# Altium schematic sheet double_single_to_diff_conv.SchDoc: Single ended to differential analog signal conversion
size A4; DocumentNumber: ADC-SCH-08; SheetNumber: 8; SheetTotal: 20
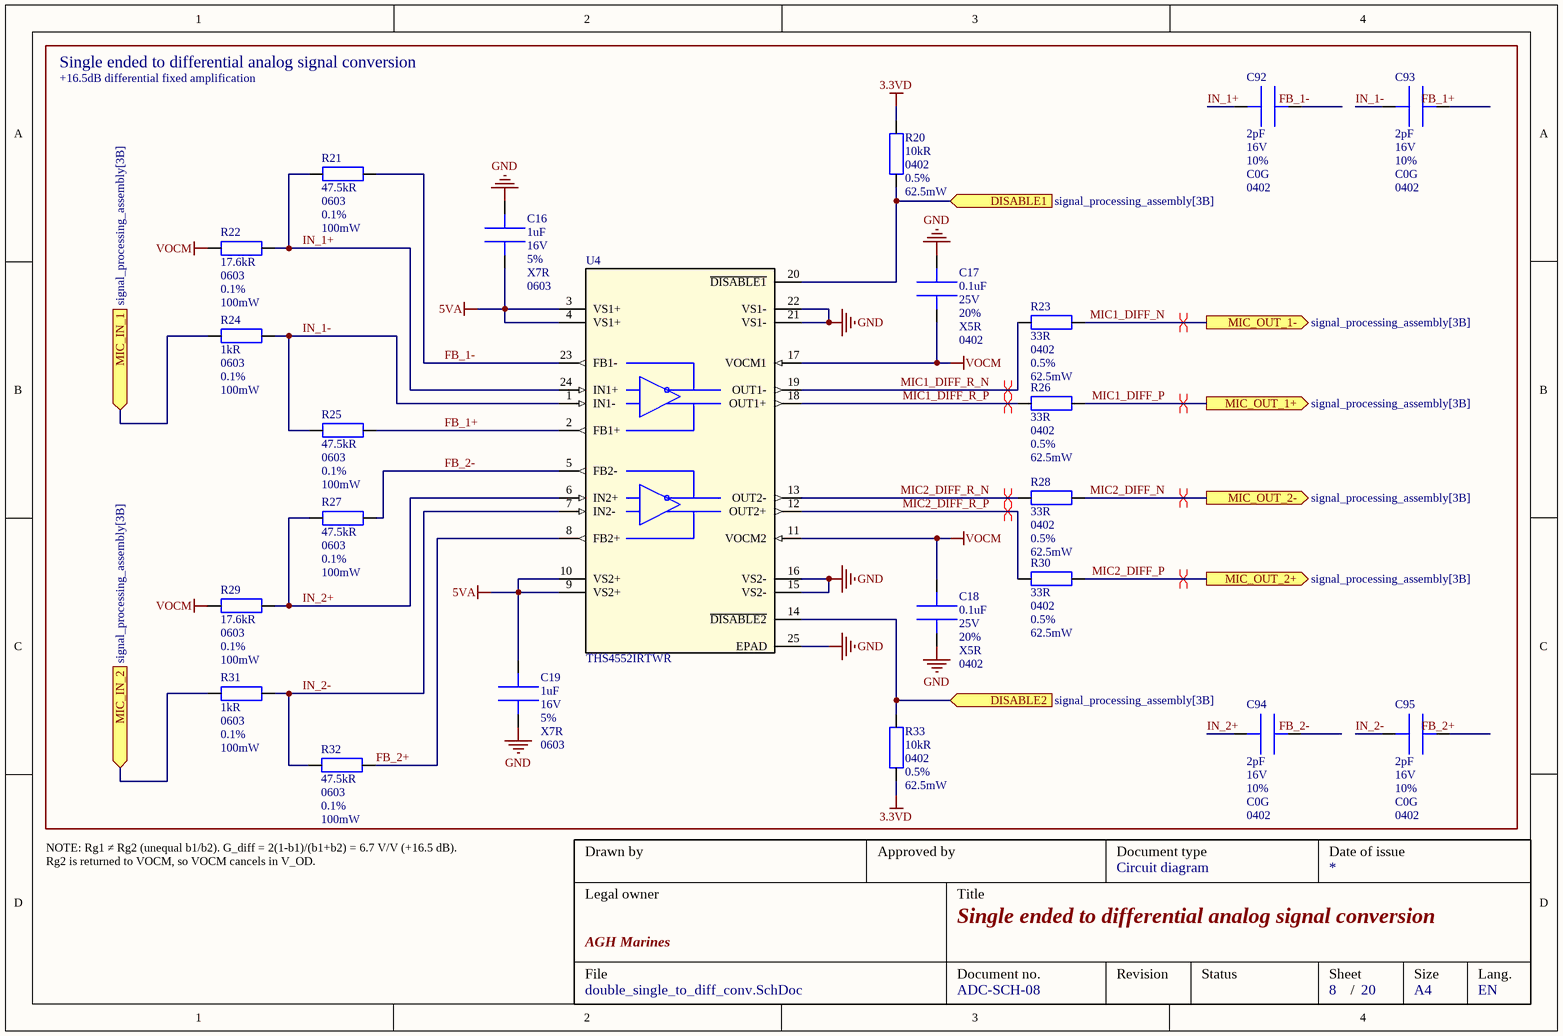
[diagram p0: double_single_to_diff_conv.SchDoc]

## Parts
C16  value 1uF  Voltage: 16V  Tolerance: 5%  Dielectric: X7R  Package: 0603  [CAPC_0603]  (hidden comment: CC0603JRX7R7BB105)
C17  value 0.1uF  Voltage: 25V  Tolerance: 20%  Dielectric: X5R  Package: 0402  [CAPC_0402]  (hidden comment: MSAST105SB5104MFNA01)
C18  value 0.1uF  Voltage: 25V  Tolerance: 20%  Dielectric: X5R  Package: 0402  [CAPC_0402]  (hidden comment: MSAST105SB5104MFNA01)
C19  value 1uF  Voltage: 16V  Tolerance: 5%  Dielectric: X7R  Package: 0603  [CAPC_0603]  (hidden comment: CC0603JRX7R7BB105)
C92  value 2pF  Voltage: 16V  Tolerance: 10%  Dielectric: C0G  Package: 0402  [CAPC_0402]  (hidden comment: GJM1555C1H2R0CB01J)
C93  value 2pF  Voltage: 16V  Tolerance: 10%  Dielectric: C0G  Package: 0402  [CAPC_0402]  (hidden comment: GJM1555C1H2R0CB01J)
C94  value 2pF  Voltage: 16V  Tolerance: 10%  Dielectric: C0G  Package: 0402  [CAPC_0402]  (hidden comment: GJM1555C1H2R0CB01J)
C95  value 2pF  Voltage: 16V  Tolerance: 10%  Dielectric: C0G  Package: 0402  [CAPC_0402]  (hidden comment: GJM1555C1H2R0CB01J)
R20  value 10kR  Package: 0402  Tolerance: 0.5%  Power: 62.5mW  [RESC_0402]  (hidden comment: AC0402DR-0710KL)
R21  value 47.5kR  Package: 0603  Tolerance: 0.1%  Power: 100mW  [RESC_0603]  (hidden comment: ERA-3AEB4752V)
R22  value 17.6kR  Package: 0603  Tolerance: 0.1%  Power: 100mW  [RESC_0603]  (hidden comment: TNPW060317K6BEEA)
R23  value 33R  Package: 0402  Tolerance: 0.5%  Power: 62.5mW  [RESC_0402]  (hidden comment: RG1005R-330-D-T10)
R24  value 1kR  Package: 0603  Tolerance: 0.1%  Power: 100mW  [RESC_0603]  (hidden comment: RP0603BRD071KL)
R25  value 47.5kR  Package: 0603  Tolerance: 0.1%  Power: 100mW  [RESC_0603]  (hidden comment: ERA-3AEB4752V)
R26  value 33R  Package: 0402  Tolerance: 0.5%  Power: 62.5mW  [RESC_0402]  (hidden comment: RG1005R-330-D-T10)
R27  value 47.5kR  Package: 0603  Tolerance: 0.1%  Power: 100mW  [RESC_0603]  (hidden comment: ERA-3AEB4752V)
R28  value 33R  Package: 0402  Tolerance: 0.5%  Power: 62.5mW  [RESC_0402]  (hidden comment: RG1005R-330-D-T10)
R29  value 17.6kR  Package: 0603  Tolerance: 0.1%  Power: 100mW  [RESC_0603]  (hidden comment: TNPW060317K6BEEA)
R30  value 33R  Package: 0402  Tolerance: 0.5%  Power: 62.5mW  [RESC_0402]  (hidden comment: RG1005R-330-D-T10)
R31  value 1kR  Package: 0603  Tolerance: 0.1%  Power: 100mW  [RESC_0603]  (hidden comment: RP0603BRD071KL)
R32  value 47.5kR  Package: 0603  Tolerance: 0.1%  Power: 100mW  [RESC_0603]  (hidden comment: ERA-3AEB4752V)
R33  value 10kR  Package: 0402  Tolerance: 0.5%  Power: 62.5mW  [RESC_0402]  (hidden comment: AC0402DR-0710KL)
U4  THS4552IRTWR  [IC_QFN-24_UF_LIT]

## Ports
DISABLE1 (in, see signal_processing_assembly[3B]), DISABLE2 (in, see signal_processing_assembly[3B]), MIC_IN_1 (in, see signal_processing_assembly[3B]), MIC_IN_2 (in, see signal_processing_assembly[3B]), MIC_OUT_1+ (out, see signal_processing_assembly[3B]), MIC_OUT_1- (out, see signal_processing_assembly[3B]), MIC_OUT_2+ (out, see signal_processing_assembly[3B]), MIC_OUT_2- (out, see signal_processing_assembly[3B])

## Nets
3.3VD: R20.1 R33.2
5VA: C16.2 C19.1 U4.3(VS1+) U4.4(VS1+) U4.9(VS2+) U4.10(VS2+)
GND: C16.1 C17.1 C18.2 C19.2 U4.15(VS2-) U4.16(VS2-) U4.21(VS1-) U4.22(VS1-) U4.25(EPAD)
VOCM: C17.2 C18.1 R22.2 R29.2 U4.11(VOCM2) U4.17(VOCM1)
DISABLE1: R20.2 U4.20(~{DISABLE1}) ; port DISABLE1
DISABLE2: R33.1 U4.14(~{DISABLE2}) ; port DISABLE2
FB_1+: C93.1 R25.1 U4.2(FB1+)
FB_1-: C92.1 R21.1 U4.23(FB1-)
FB_2+: C95.1 R32.1 U4.8(FB2+)
FB_2-: C94.1 R27.1 U4.5(FB2-)
IN_1+: C92.2 R21.2 R22.1 U4.24(IN1+)
IN_1-: C93.2 R24.1 R25.2 U4.1(IN1-)
IN_2+: C94.2 R27.2 R29.1 U4.6(IN2+)
IN_2-: C95.2 R31.1 R32.2 U4.7(IN2-)
MIC1_DIFF_N: R23.1 ; port MIC_OUT_1-
MIC1_DIFF_P: R26.1 ; port MIC_OUT_1+
MIC1_DIFF_R_N: R23.2 U4.19(OUT1-)
MIC1_DIFF_R_P: R26.2 U4.18(OUT1+)
MIC2_DIFF_N: R28.1 ; port MIC_OUT_2-
MIC2_DIFF_P: R30.1 ; port MIC_OUT_2+
MIC2_DIFF_R_N: R28.2 U4.13(OUT2-)
MIC2_DIFF_R_P: R30.2 U4.12(OUT2+)
MIC_IN_1: R24.2 ; port MIC_IN_1
MIC_IN_2: R31.2 ; port MIC_IN_2

## Layout directives
differential pair: MIC1_DIFF_N, MIC1_DIFF_P, MIC1_DIFF_R_N, MIC1_DIFF_R_P, MIC2_DIFF_N, MIC2_DIFF_P, MIC2_DIFF_R_N, MIC2_DIFF_R_P

## Notes on the sheet
- Single ended to differential analog signal conversion
- +16.5dB differential fixed amplification
- NOTE: Rg1 ≠ Rg2 (unequal b1/b2). G_diff = 2(1-b1)/(b1+b2) = 6.7 V/V (+16.5 dB).
  Rg2 is returned to VOCM, so VOCM cancels in V_OD.
- Drawn by
- Approved by
- Document type
- Date of issue
- Legal owner
- Title
- Circuit diagram
- File
- AGH Marines
- Document no.
- Revision
- Status
- Sheet
- Size
- Lang.
- /
- A4
- EN

## Library data of the parts
C16 C19 = CC0603JRX7R7BB105: Multilayer Ceramic Capacitors MLCC - SMD/SMT 16V 1uF X7R 0603 5% HI CV; Manufacturer: YAGEO; Supplier 1: Mouser; Supplier Part Number 1: 603-CC0603JRX77BB105
C17 C18 = MSAST105SB5104MFNA01: Multilayer Ceramic Capacitors MLCC - SMD/SMT 25V 0.1uF X5R 0402 20%; Manufacturer: TAIYO YUDEN; Supplier 1: Mouser; Supplier Part Number 1: 963-MSAST105SB5104MF
C92-C95 = GJM1555C1H2R0CB01J: Multilayer Ceramic Capacitors MLCC - SMD/SMT 2 pF 50 VDC 0.25 pF 0402 C0G (NP0); Manufacturer: Murata Electronics; Supplier 1: Mouser; Supplier Part Number 1: 81-GJM1555C1H2R0CB1J
R20 R33 = AC0402DR-0710KL: Thick Film Resistors - SMD 10 kOhms 1/16 W 50 V 1% 0402 100 PPM / C - 55 C + 155 C AEC-Q200; Manufacturer: YAGEO; Supplier 1: Mouser; Supplier Part Number 1: 603-AC0402DR-0710KL
R21 R25 R27 R32 = ERA-3AEB4752V: Thin Film Resistors 0603 47.5Kohm 0.1% 25ppm; Manufacturer: Panasonic; Supplier 1: Mouser; Supplier Part Number 1: 667-ERA-3AEB4752V
R22 R29 = TNPW060317K6BEEA: Thin Film Resistors 17.6Kohms .1% 25ppm; Manufacturer: Vishay; Supplier 1: Mouser; Supplier Part Number 1: 71-TNPW060317K6BEEA
R23 R26 R28 R30 = RG1005R-330-D-T10: Thin Film Resistors - SMD 1/16W 33 Ohms 0.5% 0402 100ppm; Manufacturer: Susumu; Supplier 1: Mouser; Supplier Part Number 1: 754-RG1005R-330DT10
R24 R31 = RP0603BRD071KL: Thin Film Resistors 1/10 Wat 1K Ohm 0.1% 0603 AEC-Q200; Manufacturer: YAGEO; Supplier 1: Mouser; Supplier Part Number 1: 603-RP0603BRD071KL
U4 = THS4552IRTWR: Differential Amplifiers Dual Channel Low-No ise Precision 150- A 595-THS4552IRTWT; Manufacturer: Texas Instruments; Package: LFCSP-24; Supplier 1: Mouser; Supplier Part Number 1: 595-THS4552IRTWR